# Altium schematic sheet daucam96chan.SchDoc
size A2
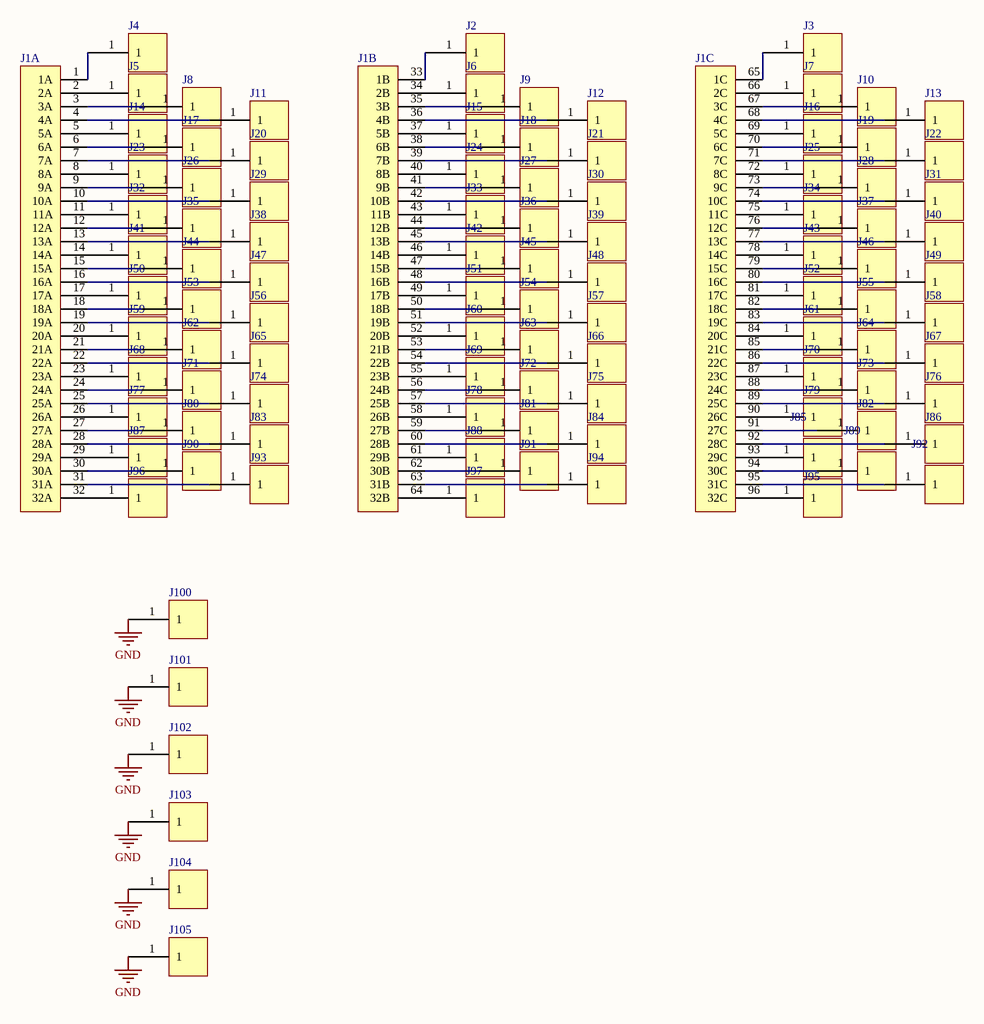
[diagram p0: daucam96chan.SchDoc]

## Parts
J1  GIAC 32x3 (A,B,C)  [daucam96]  (value not drawn)  (parts A,B,C of 3)
J2  header1  [CON1]  (value not drawn)
J3  header1  [CON1]  (value not drawn)
J4  header1  [CON1]  (value not drawn)
J5  header1  [CON1]  (value not drawn)
J6  header1  [CON1]  (value not drawn)
J7  header1  [CON1]  (value not drawn)
J8  header1  [CON1]  (value not drawn)
J9  header1  [CON1]  (value not drawn)
J10  header1  [CON1]  (value not drawn)
J11  header1  [CON1]  (value not drawn)
J12  header1  [CON1]  (value not drawn)
J13  header1  [CON1]  (value not drawn)
J14  header1  [CON1]  (value not drawn)
J15  header1  [CON1]  (value not drawn)
J16  header1  [CON1]  (value not drawn)
J17  header1  [CON1]  (value not drawn)
J18  header1  [CON1]  (value not drawn)
J19  header1  [CON1]  (value not drawn)
J20  header1  [CON1]  (value not drawn)
J21  header1  [CON1]  (value not drawn)
J22  header1  [CON1]  (value not drawn)
J23  header1  [CON1]  (value not drawn)
J24  header1  [CON1]  (value not drawn)
J25  header1  [CON1]  (value not drawn)
J26  header1  [CON1]  (value not drawn)
J27  header1  [CON1]  (value not drawn)
J28  header1  [CON1]  (value not drawn)
J29  header1  [CON1]  (value not drawn)
J30  header1  [CON1]  (value not drawn)
J31  header1  [CON1]  (value not drawn)
J32  header1  [CON1]  (value not drawn)
J33  header1  [CON1]  (value not drawn)
J34  header1  [CON1]  (value not drawn)
J35  header1  [CON1]  (value not drawn)
J36  header1  [CON1]  (value not drawn)
J37  header1  [CON1]  (value not drawn)
J38  header1  [CON1]  (value not drawn)
J39  header1  [CON1]  (value not drawn)
J40  header1  [CON1]  (value not drawn)
J41  header1  [CON1]  (value not drawn)
J42  header1  [CON1]  (value not drawn)
J43  header1  [CON1]  (value not drawn)
J44  header1  [CON1]  (value not drawn)
J45  header1  [CON1]  (value not drawn)
J46  header1  [CON1]  (value not drawn)
J47  header1  [CON1]  (value not drawn)
J48  header1  [CON1]  (value not drawn)
J49  header1  [CON1]  (value not drawn)
J50  header1  [CON1]  (value not drawn)
J51  header1  [CON1]  (value not drawn)
J52  header1  [CON1]  (value not drawn)
J53  header1  [CON1]  (value not drawn)
J54  header1  [CON1]  (value not drawn)
J55  header1  [CON1]  (value not drawn)
J56  header1  [CON1]  (value not drawn)
J57  header1  [CON1]  (value not drawn)
J58  header1  [CON1]  (value not drawn)
J59  header1  [CON1]  (value not drawn)
J60  header1  [CON1]  (value not drawn)
J61  header1  [CON1]  (value not drawn)
J62  header1  [CON1]  (value not drawn)
J63  header1  [CON1]  (value not drawn)
J64  header1  [CON1]  (value not drawn)
J65  header1  [CON1]  (value not drawn)
J66  header1  [CON1]  (value not drawn)
J67  header1  [CON1]  (value not drawn)
J68  header1  [CON1]  (value not drawn)
J69  header1  [CON1]  (value not drawn)
J70  header1  [CON1]  (value not drawn)
J71  header1  [CON1]  (value not drawn)
J72  header1  [CON1]  (value not drawn)
J73  header1  [CON1]  (value not drawn)
J74  header1  [CON1]  (value not drawn)
J75  header1  [CON1]  (value not drawn)
J76  header1  [CON1]  (value not drawn)
J77  header1  [CON1]  (value not drawn)
J78  header1  [CON1]  (value not drawn)
J79  header1  [CON1]  (value not drawn)
J80  header1  [CON1]  (value not drawn)
J81  header1  [CON1]  (value not drawn)
J82  header1  [CON1]  (value not drawn)
J83  header1  [CON1]  (value not drawn)
J84  header1  [CON1]  (value not drawn)
J85  header1  [CON1]  (value not drawn)
J86  header1  [CON1]  (value not drawn)
J87  header1  [CON1]  (value not drawn)
J88  header1  [CON1]  (value not drawn)
J89  header1  [CON1]  (value not drawn)
J90  header1  [CON1]  (value not drawn)
J91  header1  [CON1]  (value not drawn)
J92  header1  [CON1]  (value not drawn)
J93  header1  [CON1]  (value not drawn)
J94  header1  [CON1]  (value not drawn)
J95  header1  [CON1]  (value not drawn)
J96  header1  [CON1]  (value not drawn)
J97  header1  [CON1]  (value not drawn)
J100  header1  [CON1]  (value not drawn)
J101  header1  [CON1]  (value not drawn)
J102  header1  [CON1]  (value not drawn)
J103  header1  [CON1]  (value not drawn)
J104  header1  [CON1]  (value not drawn)
J105  header1  [CON1]  (value not drawn)

## Nets
GND: J100.1 J101.1 J102.1 J103.1 J104.1 J105.1
NetJ1_1: J1.1(1A) J4.1
NetJ1_2: J1.2(2A) J5.1
NetJ1_3: J1.3(3A) J8.1
NetJ1_4: J1.4(4A) J11.1
NetJ1_5: J1.5(5A) J14.1
NetJ1_6: J1.6(6A) J17.1
NetJ1_7: J1.7(7A) J20.1
NetJ1_8: J1.8(8A) J23.1
NetJ1_9: J1.9(9A) J26.1
NetJ1_10: J1.10(10A) J29.1
NetJ1_11: J1.11(11A) J32.1
NetJ1_12: J1.12(12A) J35.1
NetJ1_13: J1.13(13A) J38.1
NetJ1_14: J1.14(14A) J41.1
NetJ1_15: J1.15(15A) J44.1
NetJ1_16: J1.16(16A) J47.1
NetJ1_17: J1.17(17A) J50.1
NetJ1_18: J1.18(18A) J53.1
NetJ1_19: J1.19(19A) J56.1
NetJ1_20: J1.20(20A) J59.1
NetJ1_21: J1.21(21A) J62.1
NetJ1_22: J1.22(22A) J65.1
NetJ1_23: J1.23(23A) J68.1
NetJ1_24: J1.24(24A) J71.1
NetJ1_25: J1.25(25A) J74.1
NetJ1_26: J1.26(26A) J77.1
NetJ1_27: J1.27(27A) J80.1
NetJ1_28: J1.28(28A) J83.1
NetJ1_29: J1.29(29A) J87.1
NetJ1_30: J1.30(30A) J90.1
NetJ1_31: J1.31(31A) J93.1
NetJ1_32: J1.32(32A) J96.1
NetJ1_33: J1.33(1B) J2.1
NetJ1_34: J1.34(2B) J6.1
NetJ1_35: J1.35(3B) J9.1
NetJ1_36: J1.36(4B) J12.1
NetJ1_37: J1.37(5B) J15.1
NetJ1_38: J1.38(6B) J18.1
NetJ1_39: J1.39(7B) J21.1
NetJ1_40: J1.40(8B) J24.1
NetJ1_41: J1.41(9B) J27.1
NetJ1_42: J1.42(10B) J30.1
NetJ1_43: J1.43(11B) J33.1
NetJ1_44: J1.44(12B) J36.1
NetJ1_45: J1.45(13B) J39.1
NetJ1_46: J1.46(14B) J42.1
NetJ1_47: J1.47(15B) J45.1
NetJ1_48: J1.48(16B) J48.1
NetJ1_49: J1.49(17B) J51.1
NetJ1_50: J1.50(18B) J54.1
NetJ1_51: J1.51(19B) J57.1
NetJ1_52: J1.52(20B) J60.1
NetJ1_53: J1.53(21B) J63.1
NetJ1_54: J1.54(22B) J66.1
NetJ1_55: J1.55(23B) J69.1
NetJ1_56: J1.56(24B) J72.1
NetJ1_57: J1.57(25B) J75.1
NetJ1_58: J1.58(26B) J78.1
NetJ1_59: J1.59(27B) J81.1
NetJ1_60: J1.60(28B) J84.1
NetJ1_61: J1.61(29B) J88.1
NetJ1_62: J1.62(30B) J91.1
NetJ1_63: J1.63(31B) J94.1
NetJ1_64: J1.64(32B) J97.1
NetJ1_65: J1.65(1C) J3.1
NetJ1_66: J1.66(2C) J7.1
NetJ1_67: J1.67(3C) J10.1
NetJ1_68: J1.68(4C) J13.1
NetJ1_69: J1.69(5C) J16.1
NetJ1_70: J1.70(6C) J19.1
NetJ1_71: J1.71(7C) J22.1
NetJ1_72: J1.72(8C) J25.1
NetJ1_73: J1.73(9C) J28.1
NetJ1_74: J1.74(10C) J31.1
NetJ1_75: J1.75(11C) J34.1
NetJ1_76: J1.76(12C) J37.1
NetJ1_77: J1.77(13C) J40.1
NetJ1_78: J1.78(14C) J43.1
NetJ1_79: J1.79(15C) J46.1
NetJ1_80: J1.80(16C) J49.1
NetJ1_81: J1.81(17C) J52.1
NetJ1_82: J1.82(18C) J55.1
NetJ1_83: J1.83(19C) J58.1
NetJ1_84: J1.84(20C) J61.1
NetJ1_85: J1.85(21C) J64.1
NetJ1_86: J1.86(22C) J67.1
NetJ1_87: J1.87(23C) J70.1
NetJ1_88: J1.88(24C) J73.1
NetJ1_89: J1.89(25C) J76.1
NetJ1_90: J1.90(26C) J79.1
NetJ1_91: J1.91(27C) J82.1
NetJ1_92: J1.92(28C) J86.1
NetJ1_93: J1.93(29C) J85.1
NetJ1_94: J1.94(30C) J89.1
NetJ1_95: J1.95(31C) J92.1
NetJ1_96: J1.96(32C) J95.1